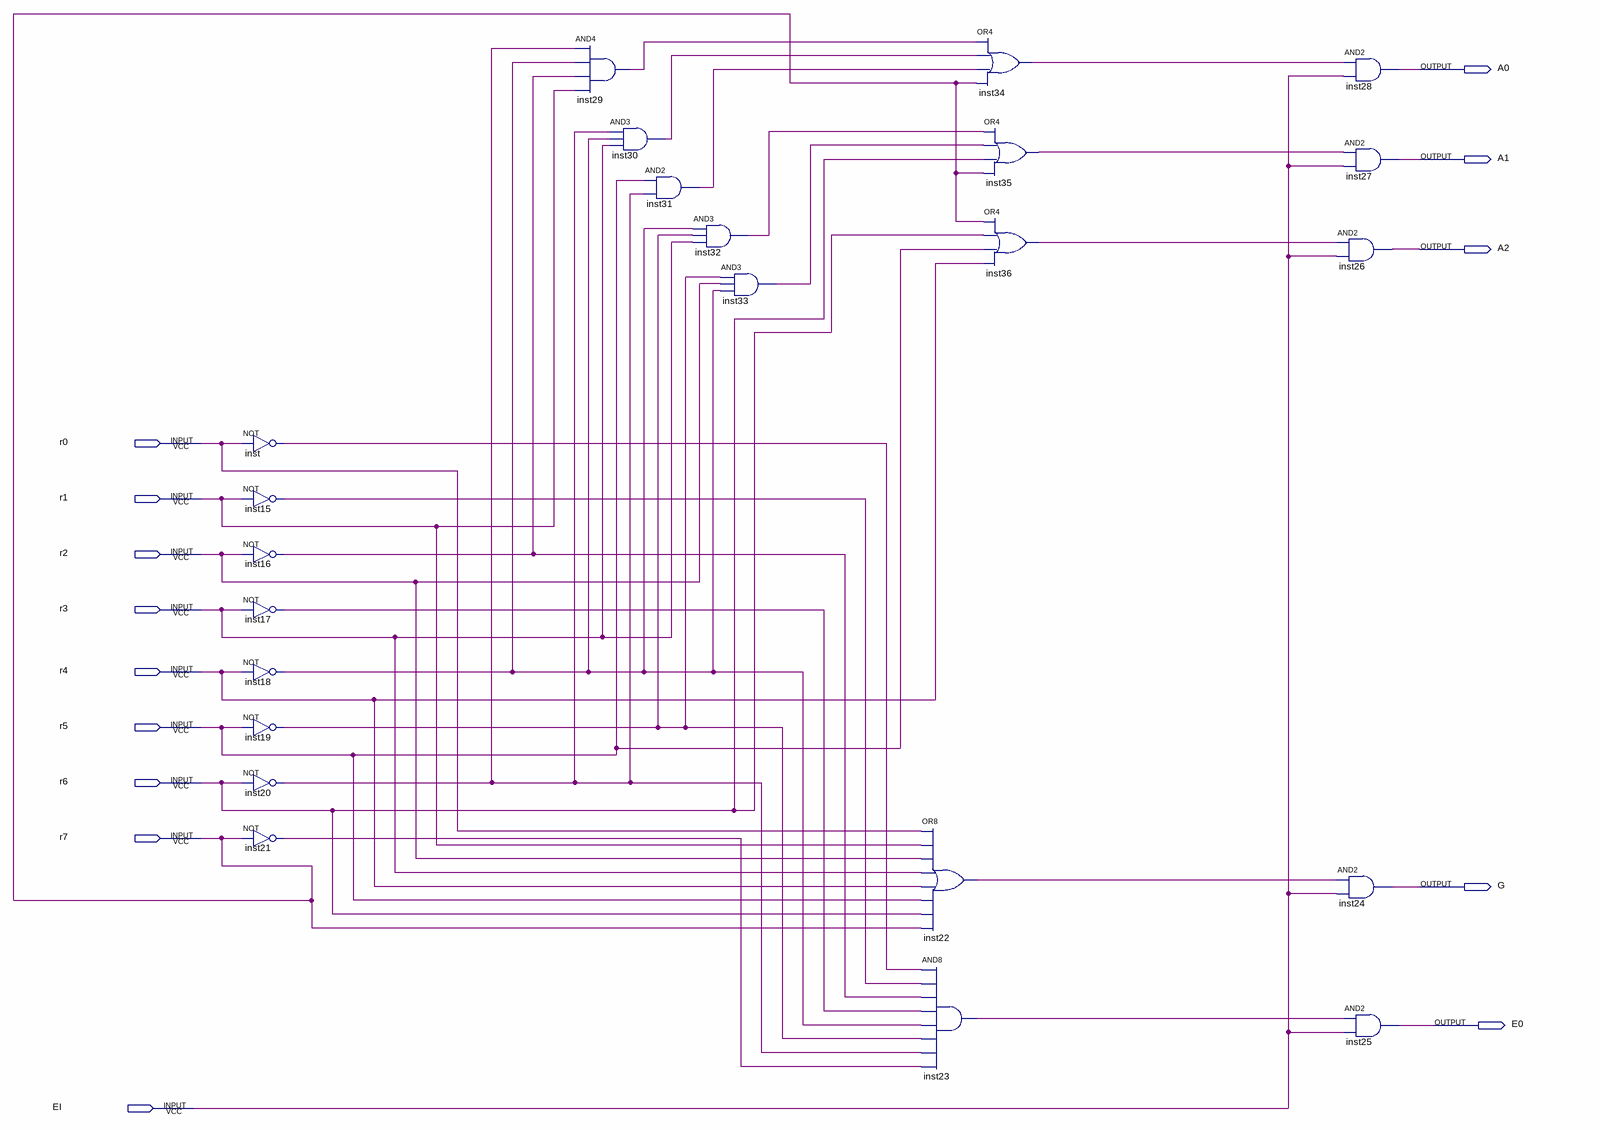
[diagram p0: schematic sheet]
// Quartus schematic encoder_8-3.bdf as structural Verilog: 23 symbols, 14 pins
module \encoder_8-3  (
  input  r0,
  input  r1,
  input  r2,
  input  r3,
  input  r4,
  input  r5,
  input  r6,
  input  r7,
  input  EI,
  output A0,
  output A1,
  output A2,
  output G,
  output E0
);

  wire inst15_out, inst16_out, inst17_out, inst18_out, inst19_out, inst20_out, inst21_out, inst22_out,
       inst23_out, inst29_out, inst30_out, inst31_out, inst32_out, inst33_out, inst34_out, inst35_out,
       inst36_out, inst_out;

  not inst (inst_out, r0);
  not inst15 (inst15_out, r1);
  not inst16 (inst16_out, r2);
  not inst17 (inst17_out, r3);
  not inst18 (inst18_out, r4);
  not inst19 (inst19_out, r5);
  not inst20 (inst20_out, r6);
  not inst21 (inst21_out, r7);
  and inst29 (inst29_out, inst20_out, inst18_out, inst16_out, r1);
  and inst30 (inst30_out, inst20_out, inst18_out, r3);
  and inst31 (inst31_out, r5, inst20_out);
  and inst32 (inst32_out, inst18_out, inst19_out, r3);
  and inst33 (inst33_out, inst19_out, r2, inst18_out);
  or inst22 (inst22_out, r0, r1, r2, r3, r4, r5, r6, r7);
  and inst23 (inst23_out, inst_out, inst15_out, inst16_out, inst17_out, inst18_out, inst19_out, inst20_out, inst21_out);
  or inst34 (inst34_out, inst29_out, inst30_out, inst31_out, r7);
  or inst35 (inst35_out, inst32_out, inst33_out, r6, r7);
  or inst36 (inst36_out, r7, r6, r5, r4);
  and inst28 (A0, inst34_out, EI);
  and inst27 (A1, inst35_out, EI);
  and inst26 (A2, inst36_out, EI);
  and inst24 (G, inst22_out, EI);
  and inst25 (E0, inst23_out, EI);
endmodule
